# Altium schematic sheet [05] - HISTORICO REVISAO.SchDoc
size A3; Engineer: jpnbino; DocumentNumber: 6; SheetNumber: 6; SheetTotal: 6
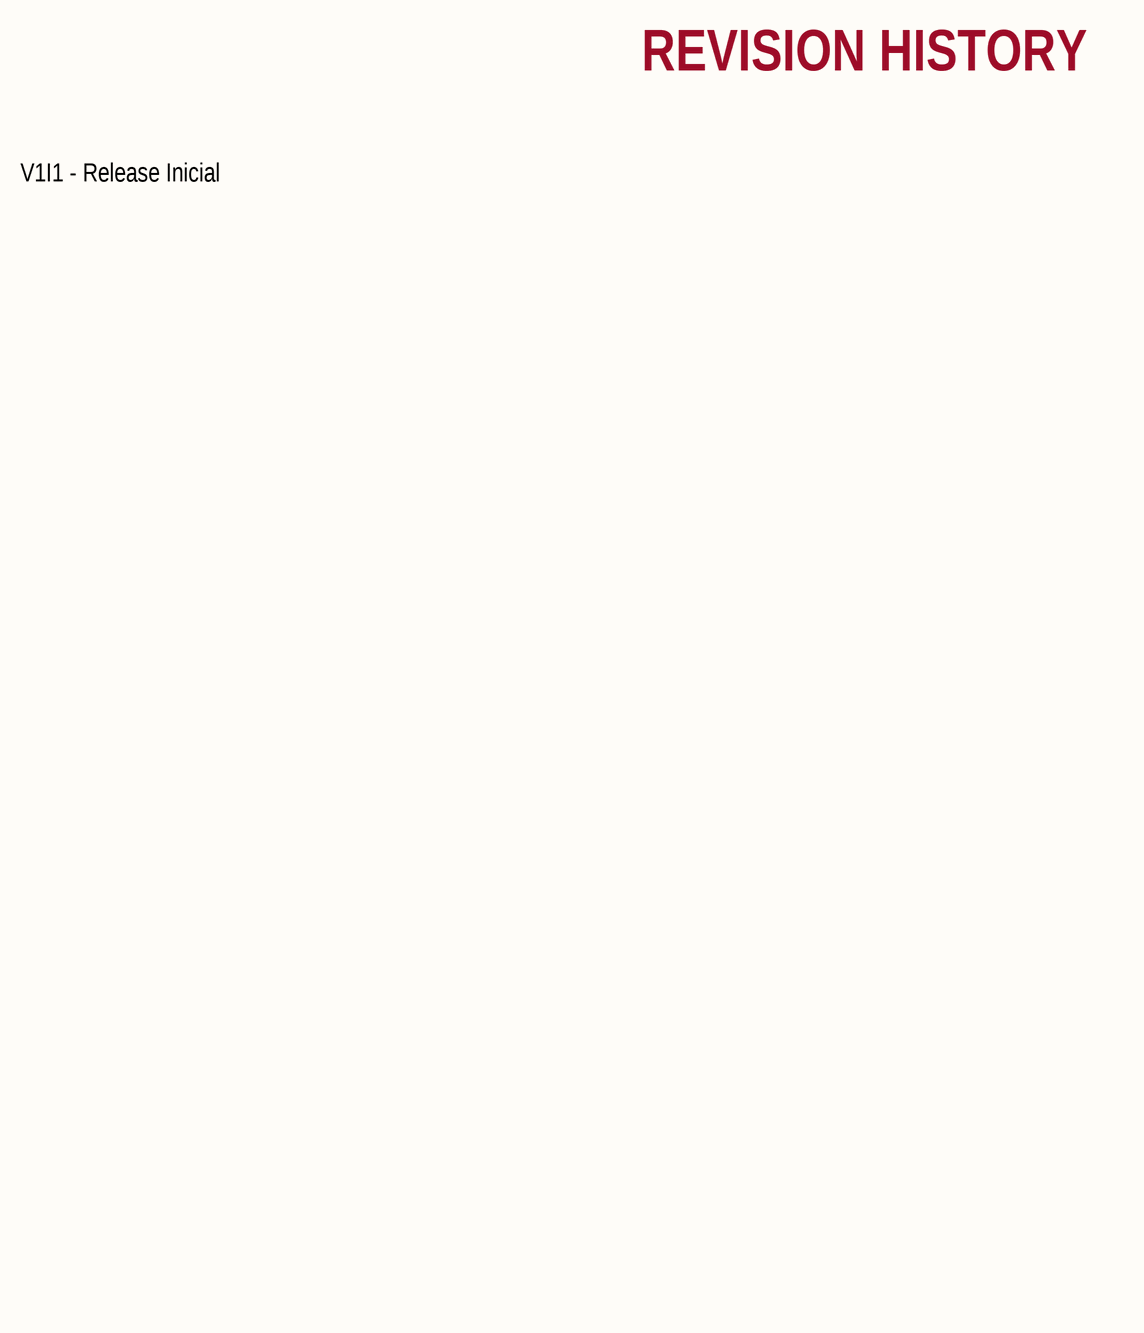
[diagram p0: [05] - HISTORICO REVISAO.SchDoc]

## Notes on the sheet
- REVISION HISTORY
- V1I1 - Release Inicial
- CLOCKS (CPU & PCIE)
- Project:
- Revision:
- Engineer:
- Title:
- Pag
- of
- Embedded Things
- Date:
- Hour:
- Variant: